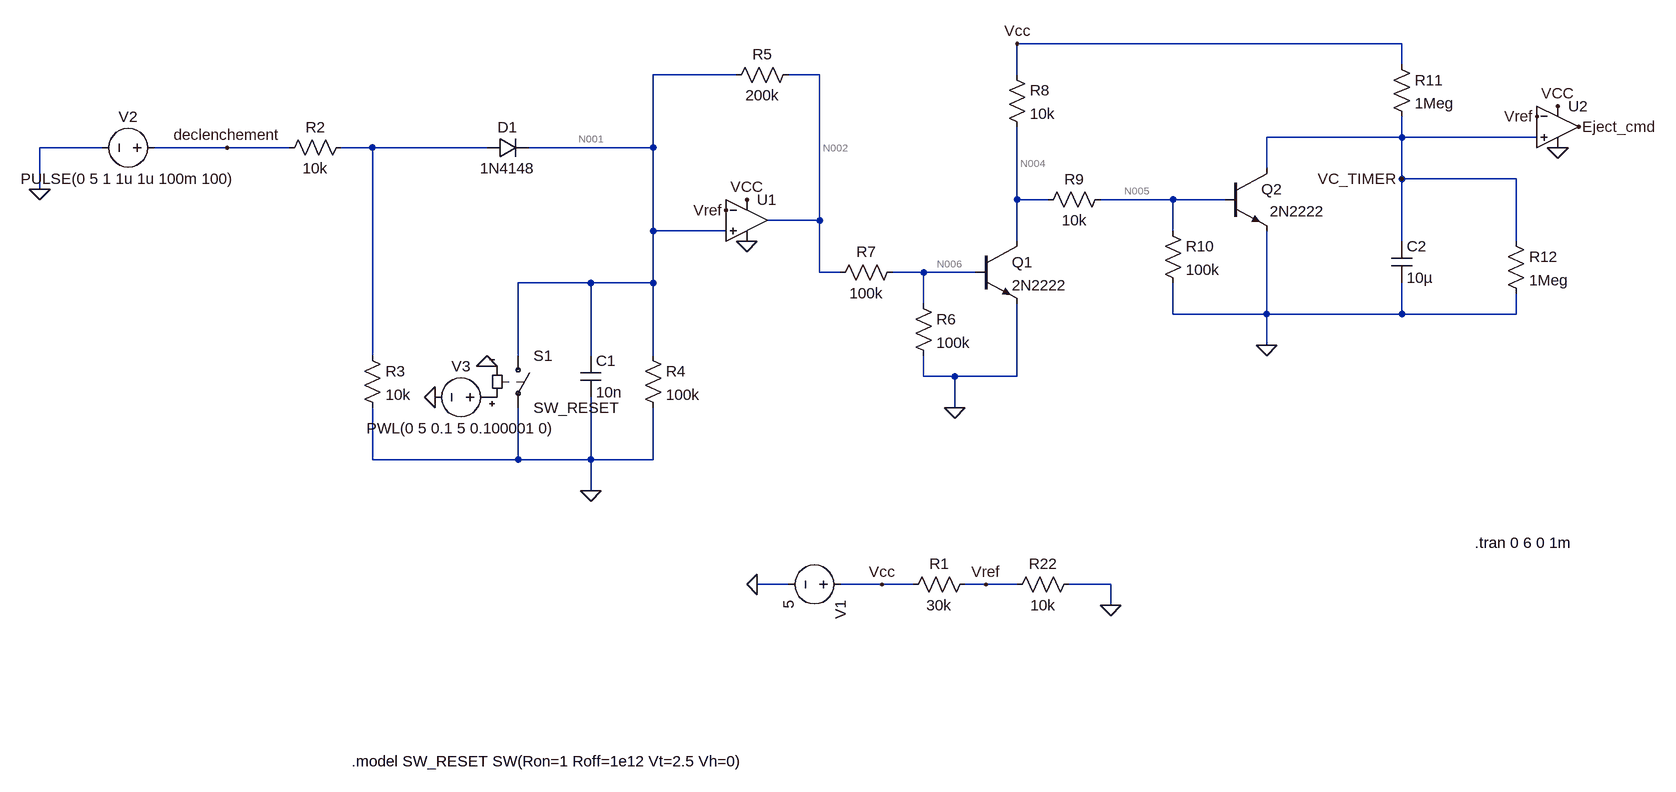
[diagram p0: schematic Draft2.asc]
Draft2.asc, the LTspice schematic file:
Version 4.1
SHEET 1 3588 1492
WIRE 2224 208 1632 208
WIRE 2224 240 2224 208
WIRE 1200 256 1072 256
WIRE 1328 256 1280 256
WIRE 1632 256 1632 208
WIRE 2224 352 2224 320
WIRE 2224 352 2016 352
WIRE 2432 352 2224 352
WIRE 224 368 128 368
WIRE 416 368 304 368
WIRE 512 368 416 368
WIRE 640 368 592 368
WIRE 816 368 640 368
WIRE 1072 368 1072 256
WIRE 1072 368 880 368
WIRE 2016 400 2016 352
WIRE 2224 416 2224 352
WIRE 2400 416 2224 416
WIRE 128 432 128 368
WIRE 1632 448 1632 336
WIRE 1680 448 1632 448
WIRE 1872 448 1760 448
WIRE 1952 448 1872 448
WIRE 1328 480 1328 256
WIRE 1328 480 1248 480
WIRE 1072 496 1072 368
WIRE 1184 496 1072 496
WIRE 1872 496 1872 448
WIRE 1632 512 1632 448
WIRE 2224 512 2224 416
WIRE 2400 512 2400 416
WIRE 1328 560 1328 480
WIRE 1360 560 1328 560
WIRE 1488 560 1440 560
WIRE 1568 560 1488 560
WIRE 976 576 864 576
WIRE 1072 576 1072 496
WIRE 1072 576 976 576
WIRE 1488 608 1488 560
WIRE 1872 624 1872 576
WIRE 2016 624 2016 496
WIRE 2016 624 1872 624
WIRE 2224 624 2224 576
WIRE 2224 624 2016 624
WIRE 2400 624 2400 592
WIRE 2400 624 2224 624
WIRE 2016 672 2016 624
WIRE 640 688 640 368
WIRE 864 688 864 576
WIRE 976 688 976 576
WIRE 1072 688 1072 576
WIRE 1488 720 1488 688
WIRE 1536 720 1488 720
WIRE 1632 720 1632 608
WIRE 1632 720 1536 720
WIRE 1536 768 1536 720
WIRE 640 848 640 768
WIRE 864 848 864 768
WIRE 864 848 640 848
WIRE 976 848 976 752
WIRE 976 848 864 848
WIRE 1072 848 1072 768
WIRE 1072 848 976 848
WIRE 976 896 976 848
WIRE 1280 1040 1232 1040
WIRE 1424 1040 1360 1040
WIRE 1472 1040 1424 1040
WIRE 1584 1040 1552 1040
WIRE 1632 1040 1584 1040
WIRE 1776 1040 1712 1040
WIRE 1776 1072 1776 1040
FLAG 1232 1040 0
FLAG 1424 1040 Vcc
FLAG 1776 1072 0
FLAG 1584 1040 Vref
FLAG 1216 448 VCC
FLAG 2464 304 VCC
FLAG 1216 512 0
FLAG 2464 368 0
FLAG 976 896 0
FLAG 1184 464 Vref
FLAG 1536 768 0
FLAG 2016 672 0
FLAG 128 432 0
FLAG 416 368 declenchement
FLAG 1632 208 Vcc
FLAG 816 704 0
FLAG 736 752 0
FLAG 2496 336 Eject_cmd
FLAG 2224 416 VC_TIMER
FLAG 2432 320 Vref
SYMBOL voltage 1376 1040 R90
WINDOW 123 0 0 Left 0
WINDOW 39 0 0 Left 0
SYMATTR InstName V1
SYMATTR Value 5
SYMBOL res 1568 1024 R90
WINDOW 0 0 56 VBottom 2
WINDOW 3 32 56 VTop 2
SYMATTR InstName R1
SYMATTR Value 30k
SYMBOL res 1728 1024 R90
WINDOW 0 0 56 VBottom 2
WINDOW 3 32 56 VTop 2
SYMATTR InstName R22
SYMATTR Value 10k
SYMBOL OpAmps\\UniversalOpAmp2 1216 480 R0
SYMATTR InstName U1
SYMBOL OpAmps\\UniversalOpAmp2 2464 336 R0
SYMATTR InstName U2
SYMBOL res 608 352 R90
WINDOW 0 0 56 VBottom 2
WINDOW 3 32 56 VTop 2
SYMATTR InstName R2
SYMATTR Value 10k
SYMBOL res 624 672 R0
SYMATTR InstName R3
SYMATTR Value 10k
SYMBOL diode 816 384 R270
WINDOW 0 32 32 VTop 2
WINDOW 3 0 32 VBottom 2
SYMATTR InstName D1
SYMATTR Value 1N4148
SYMBOL cap 960 688 R0
SYMATTR InstName C1
SYMATTR Value 10n
SYMBOL res 1056 672 R0
SYMATTR InstName R4
SYMATTR Value 100k
SYMBOL res 1296 240 R90
WINDOW 0 0 56 VBottom 2
WINDOW 3 32 56 VTop 2
SYMATTR InstName R5
SYMATTR Value 200k
SYMBOL sw 864 672 R0
SYMATTR InstName S1
SYMATTR Value SW_RESET
SYMBOL res 1472 592 R0
SYMATTR InstName R6
SYMATTR Value 100k
SYMBOL res 1456 544 R90
WINDOW 0 0 56 VBottom 2
WINDOW 3 32 56 VTop 2
SYMATTR InstName R7
SYMATTR Value 100k
SYMBOL npn 1568 512 R0
SYMATTR InstName Q1
SYMATTR Value 2N2222
SYMBOL npn 1952 400 R0
WINDOW 3 69 66 Left 2
SYMATTR Value 2N2222
SYMATTR InstName Q2
SYMBOL res 1616 240 R0
SYMATTR InstName R8
SYMATTR Value 10k
SYMBOL res 1776 432 R90
WINDOW 0 0 56 VBottom 2
WINDOW 3 32 56 VTop 2
SYMATTR InstName R9
SYMATTR Value 10k
SYMBOL res 1856 480 R0
SYMATTR InstName R10
SYMATTR Value 100k
SYMBOL res 2208 224 R0
SYMATTR InstName R11
SYMATTR Value 1Meg
SYMBOL res 2384 496 R0
SYMATTR InstName R12
SYMATTR Value 1Meg
SYMBOL cap 2208 512 R0
SYMATTR InstName C2
SYMATTR Value 10µ
SYMBOL voltage 320 368 R90
WINDOW 0 -32 56 VBottom 2
WINDOW 3 32 56 VTop 2
WINDOW 123 0 0 Left 0
WINDOW 39 0 0 Left 0
SYMATTR InstName V2
SYMATTR Value PULSE(0 5 1 1u 1u 100m 100)
SYMBOL voltage 832 752 R90
WINDOW 0 -32 56 VBottom 2
WINDOW 3 32 56 VTop 2
WINDOW 123 0 0 Left 0
WINDOW 39 0 0 Left 0
SYMATTR InstName V3
SYMATTR Value PWL(0 5 0.1 5 0.100001 0)
TEXT 2336 976 Left 2 !.tran 0 6 0 1m
TEXT 608 1312 Left 2 !.model SW_RESET SW(Ron=1 Roff=1e12 Vt=2.5 Vh=0)

The netlist it stands for:
* Draft2.asc
V1 Vcc 0 5
R1 Vref Vcc 30k
R22 0 Vref 10k
X§U1 N001 Vref Vcc 0 N002 level2 Avol=1Meg GBW=10Meg Slew=10Meg Ilimit=25m Rail=0 Vos=0 En=0 Enk=0 In=0 Ink=0 Rin=500Meg  ; pins In+ In- V+ V- OUT
X§U2 VC_TIMER Vref Vcc 0 Eject_cmd level2 Avol=1Meg GBW=10Meg Slew=10Meg Ilimit=25m Rail=0 Vos=0 En=0 Enk=0 In=0 Ink=0 Rin=500Meg  ; pins In+ In- V+ V- OUT
R2 N003 declenchement 10k
R3 N003 0 10k
D1 N003 N001 1N4148
C1 N001 0 10n
R4 N001 0 100k
R5 N002 N001 200k
S1 N001 0 P001 0 SW_RESET
R6 N006 0 100k
R7 N006 N002 100k
Q1 N004 N006 0 0 2N2222
Q2 VC_TIMER N005 0 0 2N2222
R8 Vcc N004 10k
R9 N005 N004 10k
R10 N005 0 100k
R11 Vcc VC_TIMER 1Meg
R12 VC_TIMER 0 1Meg
C2 VC_TIMER 0 10µ
V2 declenchement 0 PULSE(0 5 1 1u 1u 100m 100)
V3 P001 0 PWL(0 5 0.1 5 0.100001 0)
.model D D
.lib standard.dio
.model NPN NPN
.model PNP PNP
.lib standard.bjt
.tran 0 6 0 1m
.model SW_RESET SW(Ron=1 Roff=1e12 Vt=2.5 Vh=0)
.lib UniversalOpAmp2.lib
.backanno
.end

* Results of the author's LTspice run, read from the files saved beside the schematic
* Operating Point, zero values left out:
*   V(eject_cmd) = 5.364 µV
*   V(n001) = 5.027 nV
*   V(n002) = 5.363 µV
*   V(n004) = 2.826 V
*   V(n005) = 652.6 mV
*   V(n006) = 2.823 µV
*   V(p001) = 5 V
*   V(vc_timer) = 7.702 mV
*   V(vcc) = 5 V
*   V(vref) = 1.25 V
*   I(R1) = -125 µA
*   I(R10) = 6.526 µA
*   I(R11) = 4.992 µA
*   I(R12) = 7.702 nA
*   I(R22) = -125 µA
*   I(R5) = 26.79 pA
*   I(R6) = 28.23 pA
*   I(R7) = -25.4 pA
*   I(R8) = 217.4 µA
*   I(R9) = -217.4 µA
*   I(S1) = -5.027 nA
*   I(V1) = -348.6 µA
*   Ib(Q1) = -2.83 pA
*   Ib(Q2) = 210.8 µA
*   Ic(Q1) = 2.839 pA
*   Ic(Q2) = 4.99 µA
*   Ie(Q2) = -215.8 µA
*   Ix(u1:1) = -5 nA
*   Ix(u1:2) = -2.5 nA
*   Ix(u1:3) = 614.3 nA
*   Ix(u1:4) = -456.4 nA
*   Ix(u1:5) = -52.19 pA
*   Ix(u2:1) = -4.985 nA
*   Ix(u2:2) = -2.5 nA
*   Ix(u2:3) = 614.3 nA
*   Ix(u2:4) = -456.5 nA
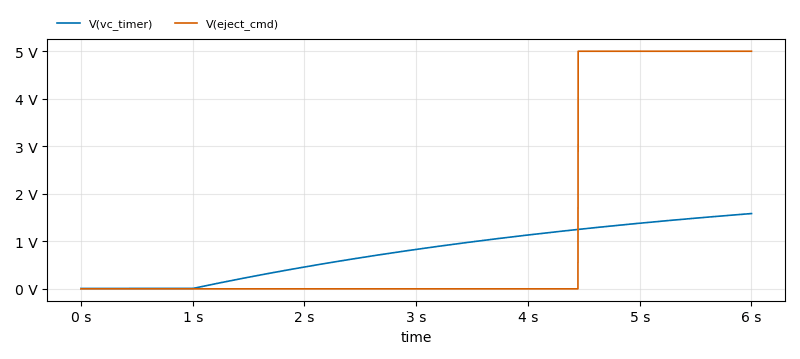
[diagram p1: Transient Analysis of Draft2.asc, plotted from the saved traces]
* Transient Analysis, 1 run:
*   V(vc_timer): min 7.696 mV, max 1.584 V, average 772.3 mV, rms 939.7 mV, last 1.584 V
*   V(eject_cmd): min 5.364 µV, max 5 V, average 1.294 V, rms 2.543 V, last 5 V